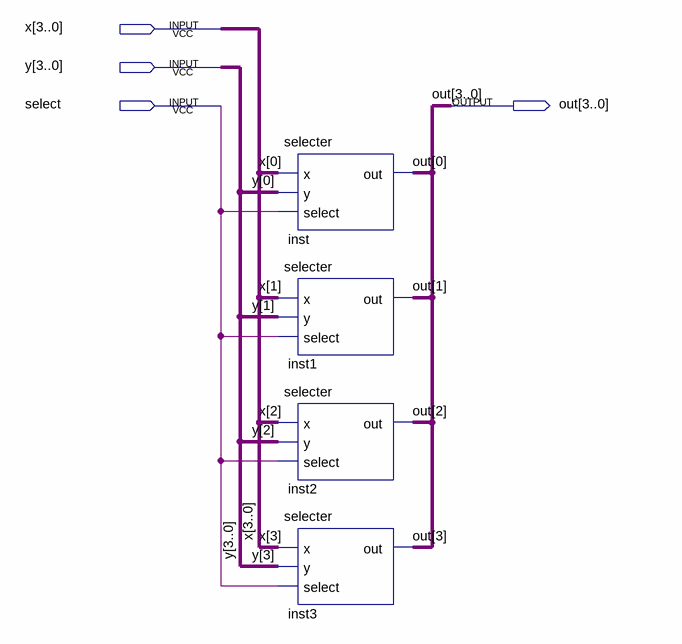
[diagram p0: schematic sheet]
// Quartus schematic selecterw4.bdf as structural Verilog: 4 symbols, 4 pins
module selecterw4 (
  input  [3:0] x,
  input  [3:0] y,
  input  select,
  output [3:0] out
);

  selecter inst (.x(x[0]), .y(y[0]), .select(select), .out(out[0]));
  selecter inst1 (.x(x[1]), .y(y[1]), .select(select), .out(out[1]));
  selecter inst2 (.x(x[2]), .y(y[2]), .select(select), .out(out[2]));
  selecter inst3 (.x(x[3]), .y(y[3]), .select(select), .out(out[3]));
endmodule
